# Altium schematic sheet ADC_Section.SchDoc
size A4; SheetNumber: 3; SheetTotal: 5
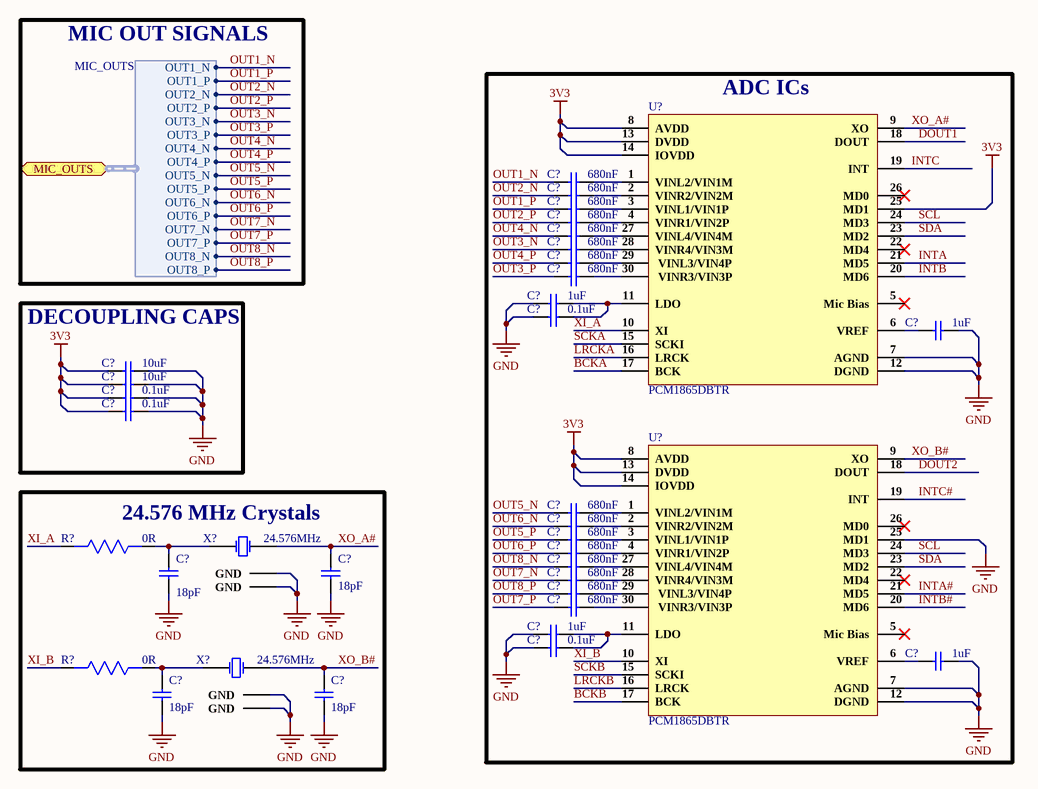
[diagram p0: ADC_Section.SchDoc]

## Parts
(Parts that share a designator on the sheet are numbered #1, #2 ... from top to bottom, then left to right.)
C?#1  680nF  [Cap 0603]
C?#2  680nF  [Cap 0603]
C?#3  680nF  [Cap 0603]
C?#4  680nF  [Cap 0603]
C?#5  680nF  [Cap 0603]
C?#6  680nF  [Cap 0603]
C?#7  680nF  [Cap 0603]
C?#8  680nF  [Cap 0603]
C?#9  1uF  [Cap 0603]
C?#10  0.1uF  [Cap 0603]
C?#11  1uF  [Cap 0603]
C?#12  10uF  [Cap 0603]
C?#13  10uF  [Cap 0603]
C?#14  0.1uF  [Cap 0603]
C?#15  0.1uF  [Cap 0603]
C?#16  680nF  [Cap 0603]
C?#17  680nF  [Cap 0603]
C?#18  680nF  [Cap 0603]
C?#19  680nF  [Cap 0603]
C?#20  680nF  [Cap 0603]
C?#21  680nF  [Cap 0603]
C?#22  18pF  [Cap 0603]
C?#23  18pF  [Cap 0603]
C?#24  680nF  [Cap 0603]
C?#25  680nF  [Cap 0603]
C?#26  1uF  [Cap 0603]
C?#27  0.1uF  [Cap 0603]
C?#28  1uF  [Cap 0603]
C?#29  18pF  [Cap0603]
C?#30  18pF  [Cap0603]
R?#1  0R  [Res0603]
R?#2  0R  [Res0603]
U?#1  PCM1865DBTR  [PCM1865DBTR]
U?#2  PCM1865DBTR  [PCM1865DBTR]
X?#1  24.576MHz  [S3224576121060]
X?#2  24.576MHz  [S3224576121060]

## Blocks framed on the sheet
ADC ICs: C?#1-C?#11 C?#16-C?#21 C?#24-C?#28 U?#1 U?#2
DECOUPLING CAPS: C?#12-C?#15
24.576 MHz Crystals: C?#22 C?#23 C?#29 C?#30 R?#1 R?#2 X?#1 X?#2

## Ports
MIC_OUTS (bidir, harness MIC_OUTS)

## Harnesses
MIC_OUTS: OUT1_N, OUT1_P, OUT2_N, OUT2_P, OUT3_N, OUT3_P, OUT4_N, OUT4_P, OUT5_N, OUT5_P, OUT6_N, OUT6_P, OUT7_N, OUT7_P, OUT8_N, OUT8_P

## Nets
3V3: C?#12.1 C?#13.1 C?#14.1 C?#15.1 U?#1.8(AVDD) U?#1.13(DVDD) U?#1.14(IOVDD) U?#1.25(MD1) U?#2.8(AVDD) U?#2.13(DVDD) U?#2.14(IOVDD)
GND: C?#9.1 C?#10.1 C?#11.2 C?#12.2 C?#13.2 C?#14.2 C?#15.2 C?#22.1 C?#23.1 C?#26.1 C?#27.1 C?#28.2 C?#29.1 C?#30.1 U?#1.7(AGND) U?#1.12(DGND) U?#2.7(AGND) U?#2.12(DGND) U?#2.25(MD1) X?#1.2(GND) X?#1.4(GND) X?#2.2(GND) X?#2.4(GND)
BCKA: U?#1.17(BCK)
BCKB: U?#2.17(BCK)
DOUT1: U?#1.18(DOUT)
DOUT2: U?#2.18(DOUT)
INTA: U?#1.21(MD5)
INTA#: U?#2.21(MD5)
INTB: U?#1.20(MD6)
INTB#: U?#2.20(MD6)
INTC: U?#1.19(INT)
INTC#: U?#2.19(INT)
LRCKA: U?#1.16(LRCK)
LRCKB: U?#2.16(LRCK)
OUT1_N: C?#1.1 ; port MIC_OUTS.OUT1_N
OUT1_P: C?#3.1 ; port MIC_OUTS.OUT1_P
OUT2_N: C?#2.1 ; port MIC_OUTS.OUT2_N
OUT2_P: C?#4.1 ; port MIC_OUTS.OUT2_P
OUT3_N: C?#6.1 ; port MIC_OUTS.OUT3_N
OUT3_P: C?#8.1 ; port MIC_OUTS.OUT3_P
OUT4_N: C?#5.1 ; port MIC_OUTS.OUT4_N
OUT4_P: C?#7.1 ; port MIC_OUTS.OUT4_P
OUT5_N: C?#16.1 ; port MIC_OUTS.OUT5_N
OUT5_P: C?#18.1 ; port MIC_OUTS.OUT5_P
OUT6_N: C?#17.1 ; port MIC_OUTS.OUT6_N
OUT6_P: C?#19.1 ; port MIC_OUTS.OUT6_P
OUT7_N: C?#21.1 ; port MIC_OUTS.OUT7_N
OUT7_P: C?#25.1 ; port MIC_OUTS.OUT7_P
OUT8_N: C?#20.1 ; port MIC_OUTS.OUT8_N
OUT8_P: C?#24.1 ; port MIC_OUTS.OUT8_P
SCKA: U?#1.15(SCKI)
SCKB: U?#2.15(SCKI)
SCL: U?#1.24(MD3) U?#2.24(MD3)
SDA: U?#1.23(MD2) U?#2.23(MD2)
XI_A: R?#1.2 U?#1.10(XI)
XI_B: R?#2.2 U?#2.10(XI)
XO_A#: C?#23.2 U?#1.9(XO) X?#1.3(OSC2)
XO_B#: C?#30.2 U?#2.9(XO) X?#2.3(OSC2)
NetC?#1_2: C?#1.2 U?#1.1(VINL2/VIN1M)
NetC?#2_2: C?#2.2 U?#1.2(VINR2/VIN2M)
NetC?#3_2: C?#3.2 U?#1.3(VINL1/VIN1P)
NetC?#4_2: C?#4.2 U?#1.4(VINR1/VIN2P)
NetC?#5_2: C?#5.2 U?#1.27(VINL4/VIN4M)
NetC?#6_2: C?#6.2 U?#1.28(VINR4/VIN3M)
NetC?#7_2: C?#7.2 U?#1.29(VINL3/VIN4P)
NetC?#8_2: C?#8.2 U?#1.30(VINR3/VIN3P)
NetC?#9_2: C?#9.2 C?#10.2 U?#1.11(LDO)
NetC?#11_1: C?#11.1 U?#1.6(VREF)
NetC?#16_2: C?#16.2 U?#2.1(VINL2/VIN1M)
NetC?#17_2: C?#17.2 U?#2.2(VINR2/VIN2M)
NetC?#18_2: C?#18.2 U?#2.3(VINL1/VIN1P)
NetC?#19_2: C?#19.2 U?#2.4(VINR1/VIN2P)
NetC?#20_2: C?#20.2 U?#2.27(VINL4/VIN4M)
NetC?#21_2: C?#21.2 U?#2.28(VINR4/VIN3M)
NetC?#22_2: C?#22.2 R?#1.1 X?#1.1(OSC1)
NetC?#24_2: C?#24.2 U?#2.29(VINL3/VIN4P)
NetC?#25_2: C?#25.2 U?#2.30(VINR3/VIN3P)
NetC?#26_2: C?#26.2 C?#27.2 U?#2.11(LDO)
NetC?#28_1: C?#28.1 U?#2.6(VREF)
NetC?#29_2: C?#29.2 R?#2.1 X?#2.1(OSC1)

Not connected (* = marked no-connect by the designer): U?#1 5(Mic_Bias)* 22(MD4)* 26(MD0)*; U?#2 5(Mic_Bias)* 22(MD4)* 26(MD0)*

## Notes on the sheet
- MIC OUT SIGNALS
- 1
- Huzaifa Ali

## Library data of the parts
C?#1-C?#8 C?#16-C?#21 C?#24 C?#25 = CC0603KRX7R8BB684: CAP CER 0.68uF 25V X7R 10% 0603 Paper T/R; Manufacturer: Yageo; Supplier 1: Arrow Electronics; Manufacturer Part Number: CC0603KRX7R8BB684; RoHS: Yes; Category: Ceramic Capacitors; Stock 1: 8000; Pricing 1: 4000=0.02130, 8000=0.01830 (USD); Supplier Part Number 1: CC0603KRX7R8BB684
C?#9 C?#11 C?#26 C?#28 = CC0603KRX5R8BB105: CAP CER 1UF 25V X5R 0603; Manufacturer: Yageo; Tolerance: 10%; Supplier 1: Digi-Key; Manufacturer Part Number: CC0603KRX5R8BB105; RoHS: Yes; Category: Ceramic Capacitors; Stock 1: 919939; Pricing 1: 1=0.12000, 10=0.08400, 50=0.04760, 100=0.03940, 500=0.02764, 1000=0.02288 (USD); Mount: Surface Mount; Case/Package: 0603; Number of Pins: 2; Case Code (Metric): 1608; Case Code (Imperial): 0603; Min Operating Temperature: -55°C; Max Operating Temperature: 85°C; Capacitance: 1uF; Dielectric: X5R; Package Quantity: 1; Voltage Rating: 25V; Packaging: Tape and Reel; Termination: SMD/SMT; Voltage Rating (DC): 25V; Series: CC; Construction: Flat; Length: 1.6mm; Width: 0.031inch; Height: 0.8mm; Thickness: 0.035inch; Depth: 0.8mm; Radiation Hardening: No; REACH SVHC: No SVHC; Lead Free: Lead Free; Halogen Free: Halogen Free; RoHS Compliant: Yes; ComponentLink1URL: https://datasheet.ciiva.com/176/mlccorderingcode-176785.pdf?src-supplier=Digi-Key; ComponentLink1Description: https://datasheet.ciiva.com/176/mlccorderingcode-176785.pdf?src-supplier=Digi-Key; ComponentLink2URL: https://datasheet.ciiva.com/176/mlccorderingcode-176786.pdf?src-supplier=Digi-Key; ComponentLink2Description: https://datasheet.ciiva.com/176/mlccorderingcode-176786.pdf?src-supplier=Digi-Key; ComponentLink3URL: https://datasheet.ciiva.com/176/mlccorderingcode-176787.pdf?src-supplier=Digi-Key; ComponentLink3Description: https://datasheet.ciiva.com/176/mlccorderingcode-176787.pdf?src-supplier=Digi-Key; ComponentLink4URL: https://datasheet.ciiva.com/17436/upy-gphc-x5r-4v-to-50v-12-17436952.pdf?src-supplier=Avnet+Europe; ComponentLink4Description: https://datasheet.ciiva.com/17436/upy-gphc-x5r-4v-to-50v-12-17436952.pdf?src-supplier=Avnet+Europe; ComponentLink5URL: https://datasheet.ciiva.com/7978/1525783-7978171.pdf?src-supplier=Element14; ComponentLink5Description: https://datasheet.ciiva.com/7978/1525783-7978171.pdf?src-supplier=Element14; ComponentLink6URL: https://datasheet.ciiva.com/11586/upy-gphc-x5r-4v-to-50v-12-11586318.pdf?src-supplier=Avnet; ComponentLink6Description: https://datasheet.ciiva.com/11586/upy-gphc-x5r-4v-to-50v-12-11586318.pdf?src-supplier=Avnet; Supplier Part Number 1: 311-1445-1-ND
C?#10 C?#14 C?#15 C?#27 = CC0603KRX7R0BB104: CAP CER 0.1UF 100V X7R 0603; Manufacturer: Yageo; Capacitance: 100nF; Tolerance: 10%; Supplier 1: Digi-Key; Manufacturer Part Number: CC0603KRX7R0BB104; RoHS: Yes; Category: Ceramic Capacitors; Stock 1: 60476; Pricing 1: 1=0.19000, 10=0.13500, 50=0.07680, 100=0.06370, 500=0.04466, 1000=0.03696 (USD); Mount: Surface Mount; Case/Package: 0603; Case Code (Metric): 1608; Case Code (Imperial): 0603; Weight: 7.1E-05oz; Min Operating Temperature: -55°C; Max Operating Temperature: 125°C; Package Quantity: 4000; Voltage Rating: 100V; Packaging: Tape and Reel; Dielectric: X7R; Termination: SMD/SMT; Resistor Type: Ceramic; Voltage Rating (DC): 100V; Series: CC; Length: 0.063inch; Width: 0.031inch; Thickness: 0.035inch; Depth: 0.8mm; Lead Free: Lead Free; RoHS Compliant: Yes; ComponentLink1URL: https://datasheet.ciiva.com/6277/mlccorderingcode-6277030.pdf?src-supplier=Digi-Key; ComponentLink1Description: https://datasheet.ciiva.com/6277/mlccorderingcode-6277030.pdf?src-supplier=Digi-Key; ComponentLink2URL: https://datasheet.ciiva.com/6277/mlccorderingcode-6277081.pdf?src-supplier=Digi-Key; ComponentLink2Description: https://datasheet.ciiva.com/6277/mlccorderingcode-6277081.pdf?src-supplier=Digi-Key; ComponentLink3URL: https://datasheet.ciiva.com/6277/mlccorderingcode-6277082.pdf?src-supplier=Digi-Key; ComponentLink3Description: https://datasheet.ciiva.com/6277/mlccorderingcode-6277082.pdf?src-supplier=Digi-Key; Supplier Part Number 1: 311-1523-1-ND
C?#12 C?#13 = CL10A106MA8NRNC: CAP CER 10UF 25V X5R 0603; Manufacturer: Samsung; Tolerance: 20%; Supplier 1: Avnet; Manufacturer Part Number: CL10A106MA8NRNC; RoHS: Yes; Category: Ceramic Capacitors; Pricing 1: 4000=0.03753, 8000=0.03700, 16000=0.03595, 24000=0.03515, 32000=0.03383, 40000=0.03304, 400000=0.03225 (USD); Mount: Surface Mount; Case/Package: 0603; Case Code (Metric): 1608; Case Code (Imperial): 0603; Contact Plating: Tin; Min Operating Temperature: -55°C; Max Operating Temperature: 85°C; Package Quantity: 1; Packaging: Tape and Reel; Capacitance: 10uF; Voltage Rating: 25V; Dielectric: X5R; Termination: Wraparound; Series: CL; Construction: Flat; Length: 0.063inch; Width: 0.031inch; Thickness: 0.035inch; Lead Free: Lead Free; RoHS Compliant: Yes; ComponentLink1URL: https://datasheet.ciiva.com/25766/cl10a106ma8nrnc-25766562.pdf?src-supplier=Digi-Key; ComponentLink1Description: https://datasheet.ciiva.com/25766/cl10a106ma8nrnc-25766562.pdf?src-supplier=Digi-Key; Supplier Part Number 1: CL10A106MA8NRNC
C?#22 C?#23 = CC0603JRNPO9BN180: CAP SMD 18pF ±5.0% 50V NPO 0603; Manufacturer: Yageo; Tolerance: 5%; Dielectric: C0G; Temperature Coefficient: 30ppm/°C; Insulation Resistance: 100GR; Supplier 1: Newark; Manufacturer Part Number: CC0603JRNPO9BN180; RoHS: Yes; Category: Ceramic Capacitors; Stock 1: 77880; Pricing 1: 1=0.09900, 25=0.08000, 50=0.06900, 100=0.04700, 250=0.03600, 500=0.02800, 1000=0.02300, 2500=0.01900 (USD); Mount: Surface Mount; Case/Package: 0603; Number of Pins: 2; Case Code (Metric): 1608; Case Code (Imperial): 0603; Min Operating Temperature: -55°C; Max Operating Temperature: 125°C; Capacitance: 18pF; Packaging: Tape and Reel; Voltage Rating: 50V; Voltage Rating (DC): 50V; Package Quantity: 1; Termination: SMD/SMT; Resistor Type: Ceramic; Series: CC; Length: 1.6mm; Width: 0.031inch; Height: 0.8mm; Thickness: 0.035inch; Depth: 0.8mm; Radiation Hardening: No; REACH SVHC: No SVHC; Lead Free: Lead Free; RoHS Compliant: Yes; ComponentLink1URL: https://datasheet.ciiva.com/144/mlccorderingcode-144638.pdf?src-supplier=Digi-Key; ComponentLink1Description: https://datasheet.ciiva.com/144/mlccorderingcode-144638.pdf?src-supplier=Digi-Key; ComponentLink2URL: https://datasheet.ciiva.com/144/mlccorderingcode-144637.pdf?src-supplier=Digi-Key; ComponentLink2Description: https://datasheet.ciiva.com/144/mlccorderingcode-144637.pdf?src-supplier=Digi-Key; ComponentLink3URL: https://datasheet.ciiva.com/144/mlccorderingcode-144639.pdf?src-supplier=Digi-Key; ComponentLink3Description: https://datasheet.ciiva.com/144/mlccorderingcode-144639.pdf?src-supplier=Digi-Key; ComponentLink4URL: https://datasheet.ciiva.com/28450/1443161-28450477.pdf?src-supplier=Element14; ComponentLink4Description: https://datasheet.ciiva.com/28450/1443161-28450477.pdf?src-supplier=Element14; ComponentLink5URL: https://datasheet.ciiva.com/46430/1835847-46430152.pdf?src-supplier=Element14; ComponentLink5Description: https://datasheet.ciiva.com/46430/1835847-46430152.pdf?src-supplier=Element14; ComponentLink6URL: https://datasheet.ciiva.com/5425/upy-gp-np0-16v-to-50v-8-5425439.pdf?src-supplier=Mouser; ComponentLink6Description: https://datasheet.ciiva.com/5425/upy-gp-np0-16v-to-50v-8-5425439.pdf?src-supplier=Mouser; ComponentLink7URL: https://datasheet.ciiva.com/8033/1734582-8033733.pdf?src-supplier=Element14; ComponentLink7Description: https://datasheet.ciiva.com/8033/1734582-8033733.pdf?src-supplier=Element14; ComponentLink8URL: https://datasheet.ciiva.com/11587/upy-gp-np0-16v-to-50v-8-11587323.pdf?src-supplier=Avnet; ComponentLink8Description: https://datasheet.ciiva.com/11587/upy-gp-np0-16v-to-50v-8-11587323.pdf?src-supplier=Avnet; Supplier Part Number 1: 68R4719
C?#29 C?#30 = CC0603JRNPO9BN180: CAP CER 18PF 50V C0G/NPO 0603; Manufacturer: Yageo; Tolerance: 5%; Dielectric: C0G; Temperature Coefficient: 30ppm/°C; Insulation Resistance: 100GR; Supplier 1: Digi-Key; Manufacturer Part Number: CC0603JRNPO9BN180; RoHS: Yes; Category: Ceramic Capacitors; Stock 1: 936645; Pricing 1: 1=0.10000, 10=0.04000, 50=0.02200, 100=0.01790, 500=0.01282, 1000=0.01007 (USD); Mount: Surface Mount; Case/Package: 0603; Number of Pins: 2; Case Code (Metric): 1608; Case Code (Imperial): 0603; Min Operating Temperature: -55°C; Max Operating Temperature: 125°C; Capacitance: 18pF; Packaging: Tape and Reel; Voltage Rating: 50V; Voltage Rating (DC): 50V; Package Quantity: 1; Termination: SMD/SMT; Resistor Type: Ceramic; Series: CC; Length: 1.6mm; Width: 0.031inch; Height: 0.8mm; Thickness: 0.035inch; Depth: 0.8mm; Radiation Hardening: No; REACH SVHC: No SVHC; Lead Free: Lead Free; RoHS Compliant: Yes; ComponentLink1URL: https://datasheet.ciiva.com/144/mlccorderingcode-144638.pdf?src-supplier=Digi-Key; ComponentLink1Description: https://datasheet.ciiva.com/144/mlccorderingcode-144638.pdf?src-supplier=Digi-Key; ComponentLink2URL: https://datasheet.ciiva.com/144/mlccorderingcode-144637.pdf?src-supplier=Digi-Key; ComponentLink2Description: https://datasheet.ciiva.com/144/mlccorderingcode-144637.pdf?src-supplier=Digi-Key; ComponentLink3URL: https://datasheet.ciiva.com/144/mlccorderingcode-144639.pdf?src-supplier=Digi-Key; ComponentLink3Description: https://datasheet.ciiva.com/144/mlccorderingcode-144639.pdf?src-supplier=Digi-Key; ComponentLink4URL: https://datasheet.ciiva.com/28450/1443161-28450477.pdf?src-supplier=Element14; ComponentLink4Description: https://datasheet.ciiva.com/28450/1443161-28450477.pdf?src-supplier=Element14; ComponentLink5URL: https://datasheet.ciiva.com/46430/1835847-46430152.pdf?src-supplier=Element14; ComponentLink5Description: https://datasheet.ciiva.com/46430/1835847-46430152.pdf?src-supplier=Element14; ComponentLink6URL: https://datasheet.ciiva.com/5425/upy-gp-np0-16v-to-50v-8-5425439.pdf?src-supplier=Mouser; ComponentLink6Description: https://datasheet.ciiva.com/5425/upy-gp-np0-16v-to-50v-8-5425439.pdf?src-supplier=Mouser; ComponentLink7URL: https://datasheet.ciiva.com/8033/1734582-8033733.pdf?src-supplier=Element14; ComponentLink7Description: https://datasheet.ciiva.com/8033/1734582-8033733.pdf?src-supplier=Element14; ComponentLink8URL: https://datasheet.ciiva.com/11587/upy-gp-np0-16v-to-50v-8-11587323.pdf?src-supplier=Avnet; ComponentLink8Description: https://datasheet.ciiva.com/11587/upy-gp-np0-16v-to-50v-8-11587323.pdf?src-supplier=Avnet; Supplier Part Number 1: 311-1061-6-ND
R?#1 R?#2 = RC0603FR-070RL: RES SMD 0R, 1%, 0.1W, 0603; Manufacturer: Yageo; Resistance: 0mR; Power Rating: 100mW; Voltage Rating (DC): 50V; Temperature Coefficient: 200ppm/°C; Current Rating: 1A; Working Voltage: 75V; Supplier 1: Arrow Electronics; Manufacturer Part Number: RC0603FR-070RL; RoHS: Yes; Category: Chip SMD Resistors; Stock 1: 1270000; Pricing 1: 5000=0.00320, 5000=0.00490, 50000=0.00450, 500000=0.00250, 2500000=0.00150 (USD); Case/Package: 0603; Number of Pins: 2; Contact Plating: Tin,Matte; Case Code (Metric): 1608; Case Code (Imperial): 0603; Min Operating Temperature: -55°C; Max Operating Temperature: 155°C; Resistor Type: Thick Film; Packaging: Tape and Reel; Tolerance: 1%; Package Quantity: 5000; Voltage Rating: 50V; Number of Terminations: 2; Termination: SMD/SMT; Max Power Dissipation: 100mW; Features: Moisture Resistant; Length: 1.6mm; Width: 0.031inch; Height: 0.45mm; Depth: 0.8mm; Radiation Hardening: No; REACH SVHC: No SVHC; Lead Free: Lead Free; Military Standard: Not; ComponentLink1URL: https://datasheet.ciiva.com/11808/0900766b80f96399-11808172.pdf?src-supplier=RSComponents; ComponentLink1Description: https://datasheet.ciiva.com/11808/0900766b80f96399-11808172.pdf?src-supplier=RSComponents; ComponentLink2URL: https://datasheet.ciiva.com/5558/rc0603-272842-5558341.pdf?src-supplier=Mouser; ComponentLink2Description: https://datasheet.ciiva.com/5558/rc0603-272842-5558341.pdf?src-supplier=Mouser; ComponentLink3URL: https://datasheet.ciiva.com/46382/443971-46382072.pdf?src-supplier=Element14; ComponentLink3Description: https://datasheet.ciiva.com/46382/443971-46382072.pdf?src-supplier=Element14; ComponentLink4URL: https://datasheet.ciiva.com/29721/pyu-r-int-thick-7-29721178.pdf?src-supplier=Digi-Key; ComponentLink4Description: https://datasheet.ciiva.com/29721/pyu-r-int-thick-7-29721178.pdf?src-supplier=Digi-Key; ComponentLink5URL: https://datasheet.ciiva.com/5684/443971-5684699.pdf?src-supplier=Farnell; ComponentLink5Description: https://datasheet.ciiva.com/5684/443971-5684699.pdf?src-supplier=Farnell; ComponentLink6URL: https://datasheet.ciiva.com/7983/443971-7983627.pdf?src-supplier=Element14; ComponentLink6Description: https://datasheet.ciiva.com/7983/443971-7983627.pdf?src-supplier=Element14; ComponentLink7URL: https://datasheet.ciiva.com/29721/pyu-rc0603-51-rohs-l-4-29721179.pdf?src-supplier=Digi-Key; ComponentLink7Description: https://datasheet.ciiva.com/29721/pyu-rc0603-51-rohs-l-4-29721179.pdf?src-supplier=Digi-Key; ComponentLink8URL: https://datasheet.ciiva.com/22643/1868787-22643388.pdf?src-supplier=Element14; ComponentLink8Description: https://datasheet.ciiva.com/22643/1868787-22643388.pdf?src-supplier=Element14; Supplier Part Number 1: RC0603FR-070RL
U?#1 U?#2 = PCM1865DBTR: IC ADC/AUDIO 24BIT 192K 30TSSOP; Manufacturer: Texas Instruments; Interface: I2C,SPI,Serial; Operating Supply Voltage: 3.3V; Sampling Rate: 192KS/s; Resolution: 24b; Operating Supply Current: 31mA; Supply Type: Single; Number of A/D Converters: 4; Power Consumption: 145mW; Max Supply Voltage: 3.6V; Min Supply Voltage: 3V; Number of Analog Inputs: 8; Number of DAC Channels: 0; Supplier 1: Mouser; Manufacturer Part Number: PCM1865DBTR; RoHS: Yes; Category: Amplifiers - Audio; Pricing 1: 1=10.72000, 10=9.69000, 25=9.23000, 50=9.23000, 100=8.02000, 250=7.66000, 500=6.98000, 1000=6.54000, 10000=6.54000 (USD); Mount: Surface Mount; Case/Package: TSSOP; Number of Pins: 30; Weight: 0.003439oz; Contact Plating: Gold; Min Operating Temperature: -40°C; Max Operating Temperature: 125°C; Package Quantity: 2000; Packaging: Tape and Reel; Number of ADC Channels: 4; Lead Free: Lead Free; RoHS Compliant: Yes; ComponentLink1URL: https://datasheet.ciiva.com/48474/pcm1861-48474798.pdf?src-supplier=Avnet; ComponentLink1Description: https://datasheet.ciiva.com/48474/pcm1861-48474798.pdf?src-supplier=Avnet; ComponentLink2URL: https://datasheet.ciiva.com/29699/pcm1861-29699238.pdf?src-supplier=Digi-Key; ComponentLink2Description: https://datasheet.ciiva.com/29699/pcm1861-29699238.pdf?src-supplier=Digi-Key; Supplier Part Number 1: 595-PCM1865DBTR
X?#1 X?#2 = S3224576121060: 24.576MHz SMD Crystal Resonator 12pF 60Ω ±10ppm -40℃~+85℃ SMD3225-4P Crystals ROHS; Manufacturer: JGHC; Manufacturer Part Number: S3224576121060; Footprint: Custom; ComponentLink1Description: LCSC; ComponentLink1URL: https://lcsc.com/product-detail/Crystals_JGHC-S3224576121060_C390772.html; Value: 24.576MHz